# Altium schematic sheet Display.SchDoc
size A; SheetNumber: 3; SheetTotal: 5
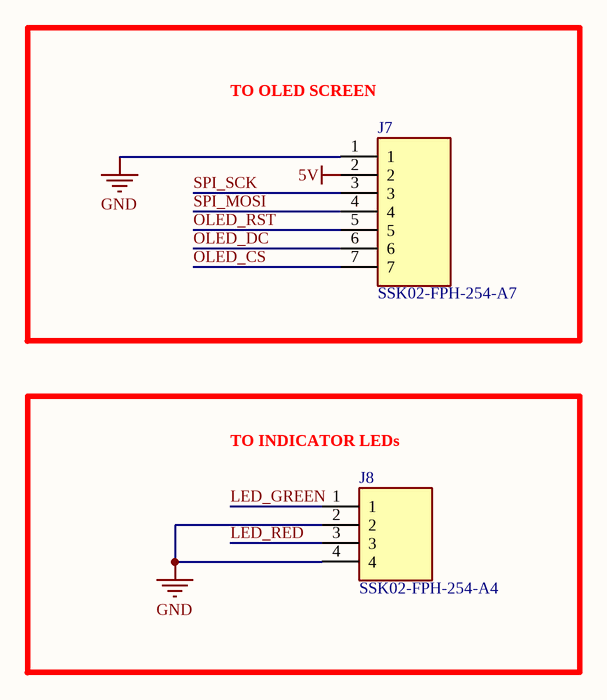
[diagram p0: Display.SchDoc]

## Parts
J7  SSK02-FPH-254-A7  [SAMESKY_SSK02-FPH-254-A7]
J8  SSK02-FPH-254-A4  [SAMESKY_SSK02-FPH-254-A4]

## Blocks framed on the sheet
TO OLED SCREEN: J7
TO INDICATOR LEDs: J8

## Nets
5V: J7.2
GND: J7.1 J8.2 J8.4
LED_GREEN: J8.1
LED_RED: J8.3
OLED_CS: J7.7
OLED_DC: J7.6
OLED_RST: J7.5
SPI_MOSI: J7.4
SPI_SCK: J7.3

## Library data of the parts
J7 = SSK02-FPH-254-A7: MF: {'manufacturer': u'Same Sky (Formerly CUI Devices)'}; Package: None; Price: None; Value: *; MP: SSK02-FPH-254-A7; Availability: Unavailable
J8 = SSK02-FPH-254-A4: 4 Position Header Connector 0.100 (2.54mm) Through Hole Gold; MF: Same Sky (Formerly CUI Devices); SnapEDA_Link: https://www.snapeda.com/parts/SSK02-FPH-254-A4/Same+Sky/view-part/?ref=snap; Package: None; Value: *; MP: SSK02-FPH-254-A4; Check_prices: https://www.snapeda.com/parts/SSK02-FPH-254-A4/Same+Sky/view-part/?ref=eda